# EAGLE schematic 5CCE2EMP_Astable_Multivibrator_Schematic (EAGLE 9.7.0)
SIM_ABSTOL: 1e-12; SIM_AC_SWEEP_TYPE: Dec; SIM_CHGTOL: 1e-15; SIM_GMIN: 1e-12; SIM_ITL1: 100; SIM_ITL2: 50; SIM_ITL4: 10; SIM_MAX_LIMIT: 2000; SIM_METHOD: TRAP; SIM_NUMPOINTS: 500; SIM_PIVREL: 1e-3; SIM_PIVTOL: 1e-13; SIM_RELTOL: 1e-3; SIM_RSHUNT: OFF; SIM_SRCSTEPS: 0; SIM_TEMPERATURE: 25.0; SIM_THEME: light; SIM_TRAN_AC_START: 1; SIM_TRAN_END: 2s; SIM_TRAN_START: 1s; SIM_TRAN_TMAX: 0.001s; SIM_TRTOL: 7; SIM_TYPE: Transient; SIM_VNTOL: 1e-6
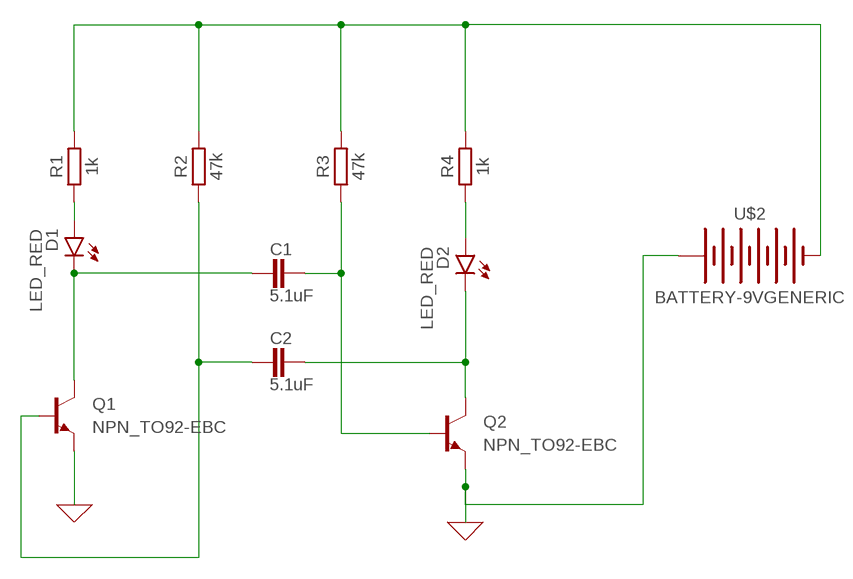
[diagram p0: schematic, sheet 1]

## Parts
C1  5.1uF  CAPACITOR_RADIAL-12.5MM-DIA  [CAPRD550W60D1025H1250B]
C2  5.1uF  CAPACITOR_RADIAL-12.5MM-DIA  [CAPRD550W60D1025H1250B]
D1  LED_RED  LED_RADIAL_RED  [LEDRD254W60D565H860B]
D2  LED_RED  LED_RADIAL_RED  [LEDRD254W60D565H860B]
Q1  NPN_TO92-EBC  [TO92]
Q2  NPN_TO92-EBC  [TO92]
R1  1k  RESISTOR__AXIAL-11.7MM-PITCH  [RESAD1176W63L850D250B]
R2  47k  RESISTOR__AXIAL-11.7MM-PITCH  [RESAD1176W63L850D250B]
R3  47k  RESISTOR__AXIAL-11.7MM-PITCH  [RESAD1176W63L850D250B]
R4  1k  RESISTOR__AXIAL-11.7MM-PITCH  [RESAD1176W63L850D250B]
U$2  BATTERY-9VGENERIC  [BATTERY-GENERIC]

## Nets
0: Q1.1(E) Q2.1(E) U$2.+ ; supply symbol labelled GND
N$1: C1.2 D1.2(C) Q1.3(C)
N$2: C2.1 D2.2(C) Q2.3(C)
N$3: R1.2 R2.2 R3.2 R4.2 U$2.-
N$4: C2.2 Q1.2(B) R2.1
N$5: C1.1 Q2.2(B) R3.1
N$6: D1.1(A) R1.1
N$7: D2.1(A) R4.1

## Library data of the parts
C1 C2 = Tinkercad:CAPACITOR: Capacitor - Generic
D1 D2 = Tinkercad:LED_RADIAL: LED - Generic
Q1 Q2 = Transistor:NPN: NPN Transistor - Generic
R1-R4 = Tinkercad:RESISTOR: Resistor Fixed - Generic
U$2 = Tinkercad:BATTERY-9V